# Altium project IoT-Speaker.PrjPcb (part 5 of 5)
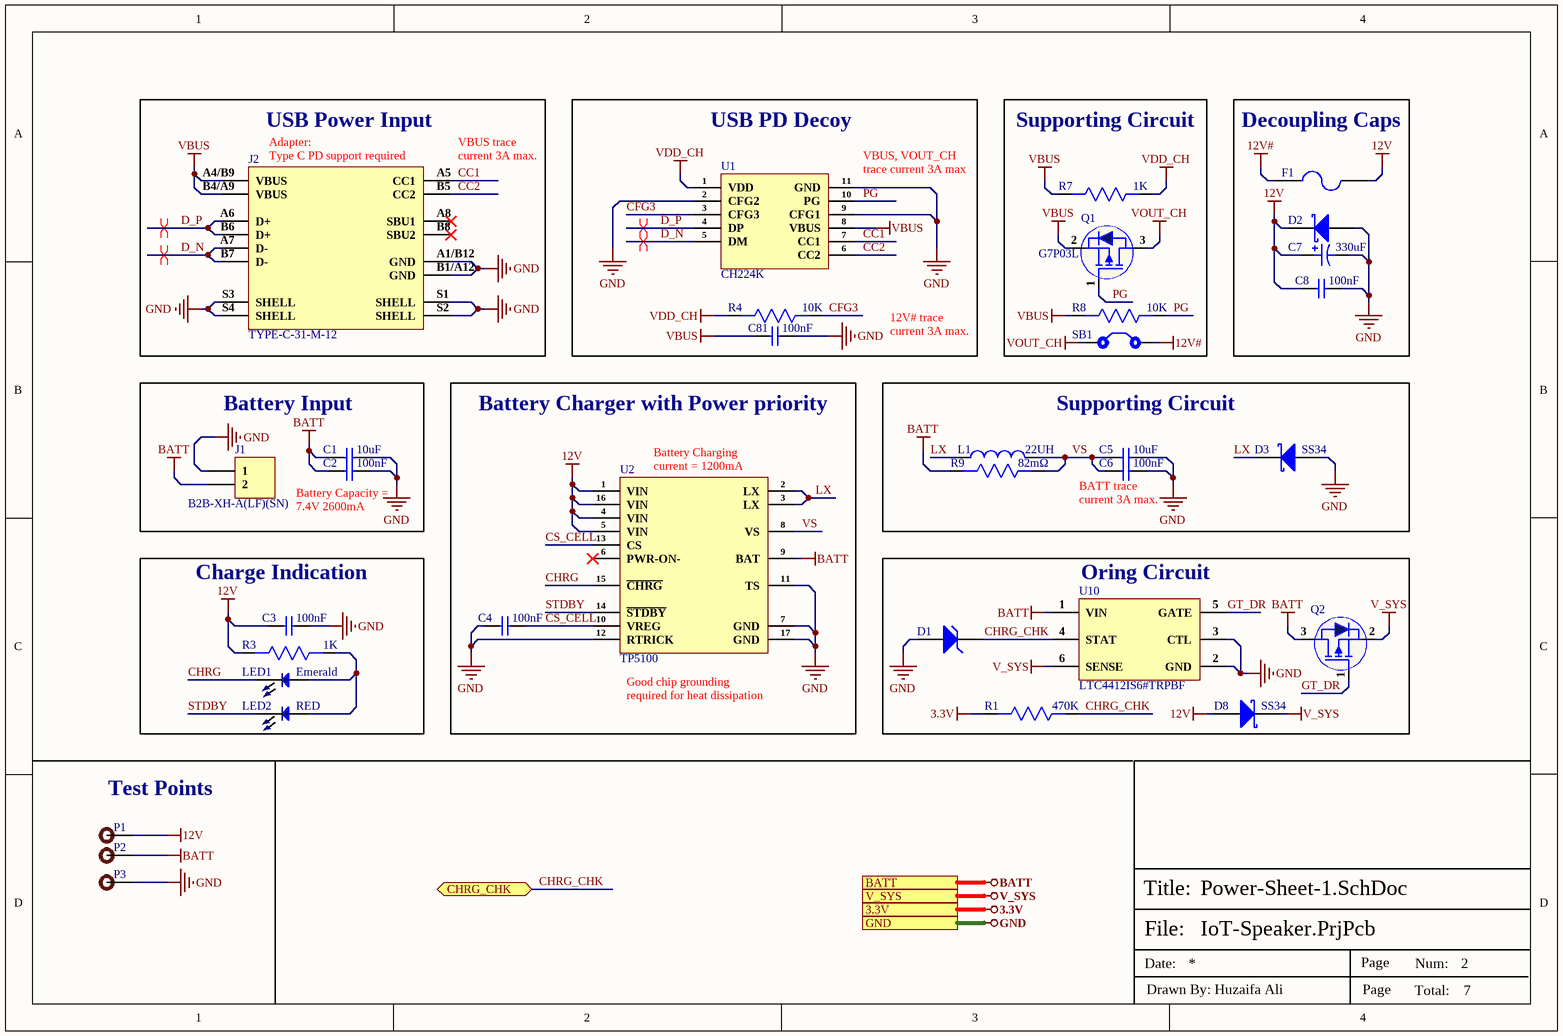
[diagram p7: Power-Sheet-1.SchDoc]

## Nets that join several sheets
3.3V: Audio-Sheet (FB2.1 R42.1), Controller-Sheet (16 pins), Power-Sheet-2 (C76.1 C77.1 P13.1 U8.5), Power-Sheet-1 (R1.2)
AGND: Audio-Sheet (29 pins), Power-Sheet-2 (C78.2 C79.2 R55.1 U9.2)
BATT: Power-Sheet-2 (U7.5), Power-Sheet-3 (Q4.2 R12.2), Power-Sheet-1 (8 pins)
BOOST_12V: Audio-Amplifier (14 pins), Power-Sheet-3 (FB1.1)
CODEC_3V3: Audio-Sheet (C45.1 C46.1 R44.1), Power-Sheet-2 (C79.1 P14.1 U9.5)
GND: Audio-Amplifier (28 pins), Controller-Sheet (33 pins), Power-Sheet-2 (11 pins), Power-Sheet-3 (11 pins), Power-Sheet-1 (29 pins)
V_SYS: Power-Sheet-2 (SW8.2), Power-Sheet-1 (D8.1 Q2.2 U10.6)
V_SYS##: Power-Sheet-2 (8 pins), Power-Sheet-3 (C11.1 C13.1 L2.1 U3.4)
BAT_ADC: Controller-Sheet (U4.4), Power-Sheet-3 (C9.2 D4.2 R10.1 R11.1)
BOOST12V_EN: Controller-Sheet (U4.33), Power-Sheet-3 (P6.1 R13.2 U3.2)
CHRG_CHK: Controller-Sheet (U4.6), Power-Sheet-1 (D1.2 R1.1 U10.4)
DAC_L+: Audio-Amplifier (SB8.1), Audio-Sheet (R40.1)
DAC_L-: Audio-Amplifier (SB9.1), Audio-Sheet (R38.1)
DAC_R+: Audio-Amplifier (SB7.1), Audio-Sheet (R41.1)
DAC_R-: Audio-Amplifier (SB6.1), Audio-Sheet (R39.1)
I2S_DIN: Audio-Sheet (R37.2), Controller-Sheet (U4.9)
I2S_DOUT: Audio-Sheet (R35.2), Controller-Sheet (U4.11)
I2S_LRCK: Audio-Sheet (R36.2), Controller-Sheet (U4.10)
I2S_MCLK: Audio-Sheet (R33.2), Controller-Sheet (SB3.2)
I2S_SCLK: Audio-Sheet (R34.2), Controller-Sheet (U4.12)
MUTE#: Audio-Amplifier (D6.2), Controller-Sheet (U4.23)
PA_EN: Audio-Amplifier (D7.2), Controller-Sheet (U4.26)
SCL: Audio-Sheet (U5.28), Controller-Sheet (R29.1 U4.30)
SDA: Audio-Sheet (U5.27), Controller-Sheet (R28.1 U4.31)
WIFI_BAT_STAT: Controller-Sheet (R22.2 U4.7), Power-Sheet-3 (R16.2)